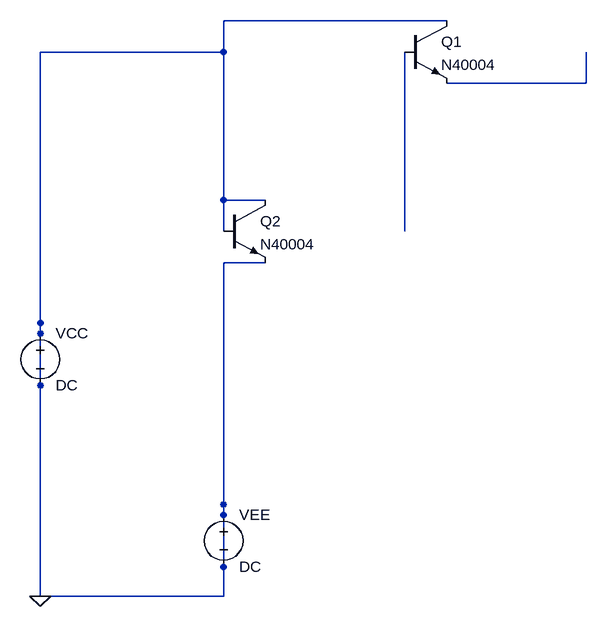
[diagram p0: schematic netlist4.asc]
netlist4.asc, the LTspice schematic file:
Version 4
SHEET 1 680 480
SYMBOL npn 819 207 R0
SYMATTR InstName Q1
SYMATTR Value N40004
SYMBOL npn 540 483 R0
SYMATTR InstName Q2
SYMATTR Value N40004
SYMBOL voltage 258 672 R0
SYMATTR InstName VCC
SYMATTR Value DC
FLAG 258 1092 0
SYMBOL voltage 540 951 R0
SYMATTR InstName VEE
SYMATTR Value DC
WIRE 258 1092 258 672
WIRE 540 967 540 810
WIRE 258 255 540 255
WIRE 258 255 258 688
WIRE 540 1092 258 1092
WIRE 540 1092 540 951
WIRE 883 207 540 207
WIRE 540 207 540 255
WIRE 819 255 819 531
WIRE 883 303 1098 303
WIRE 1098 303 1098 255
WIRE 604 483 540 483
WIRE 540 483 540 255
WIRE 540 531 540 255
WIRE 604 579 540 579
WIRE 540 579 540 810

The netlist it stands for:
* netlist4.asc
Q1 0 N001 N002 0 N40004
Q2 0 0 0 0 N40004
VCC 0 0 DC
VEE 0 0 DC
.model NPN NPN
.model PNP PNP
.lib standard.bjt
.backanno
.end